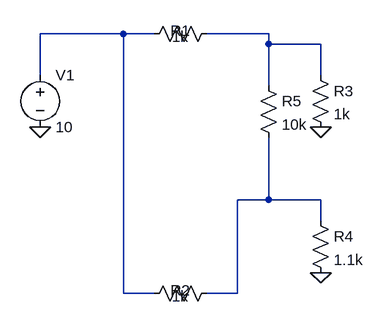
[diagram p0: schematic unseen_bridge.asc]
unseen_bridge.asc, the LTspice schematic file:
Version 4.1
SHEET 1 1600 1200
WIRE 288 80 288 16
WIRE 288 16 288 0
WIRE 288 0 192 0
WIRE 368 64 368 16
WIRE 368 16 288 16
WIRE 368 288 368 256
WIRE 368 256 288 256
WIRE 288 256 240 256
WIRE 240 256 240 400
WIRE 240 400 192 400
WIRE 288 160 288 256
WIRE 112 0 64 0
WIRE 64 0 -64 0
WIRE -64 0 -64 64
WIRE 112 400 64 400
WIRE 64 400 64 0
FLAG -64 144 0
FLAG 368 144 0
FLAG 368 368 0
SYMBOL res 96 16 R270
WINDOW 0 36 56 VBottom 2
WINDOW 3 -4 56 VTop 2
SYMATTR InstName R1
SYMATTR Value 1k
SYMBOL res 96 416 R270
WINDOW 0 36 56 VBottom 2
WINDOW 3 -4 56 VTop 2
SYMATTR InstName R2
SYMATTR Value 1k
SYMBOL res 272 64 R0
SYMATTR InstName R5
SYMATTR Value 10k
SYMBOL res 352 48 R0
SYMATTR InstName R3
SYMATTR Value 1k
SYMBOL res 352 272 R0
SYMATTR InstName R4
SYMATTR Value 1.1k
SYMBOL voltage -64 48 R0
SYMATTR InstName V1
SYMATTR Value 10

The netlist it stands for:
* unseen_bridge.asc
R1 N003 N001 1k
R2 N003 N002 1k
R5 N001 N002 10k
R3 N001 0 1k
R4 N002 0 1.1k
V1 N003 0 10
.backanno
.end